# Altium schematic sheet [04] - RAM INTERFACE.SchDoc
size A2; DocumentNumber: 2; SheetNumber: 4; SheetTotal: 10
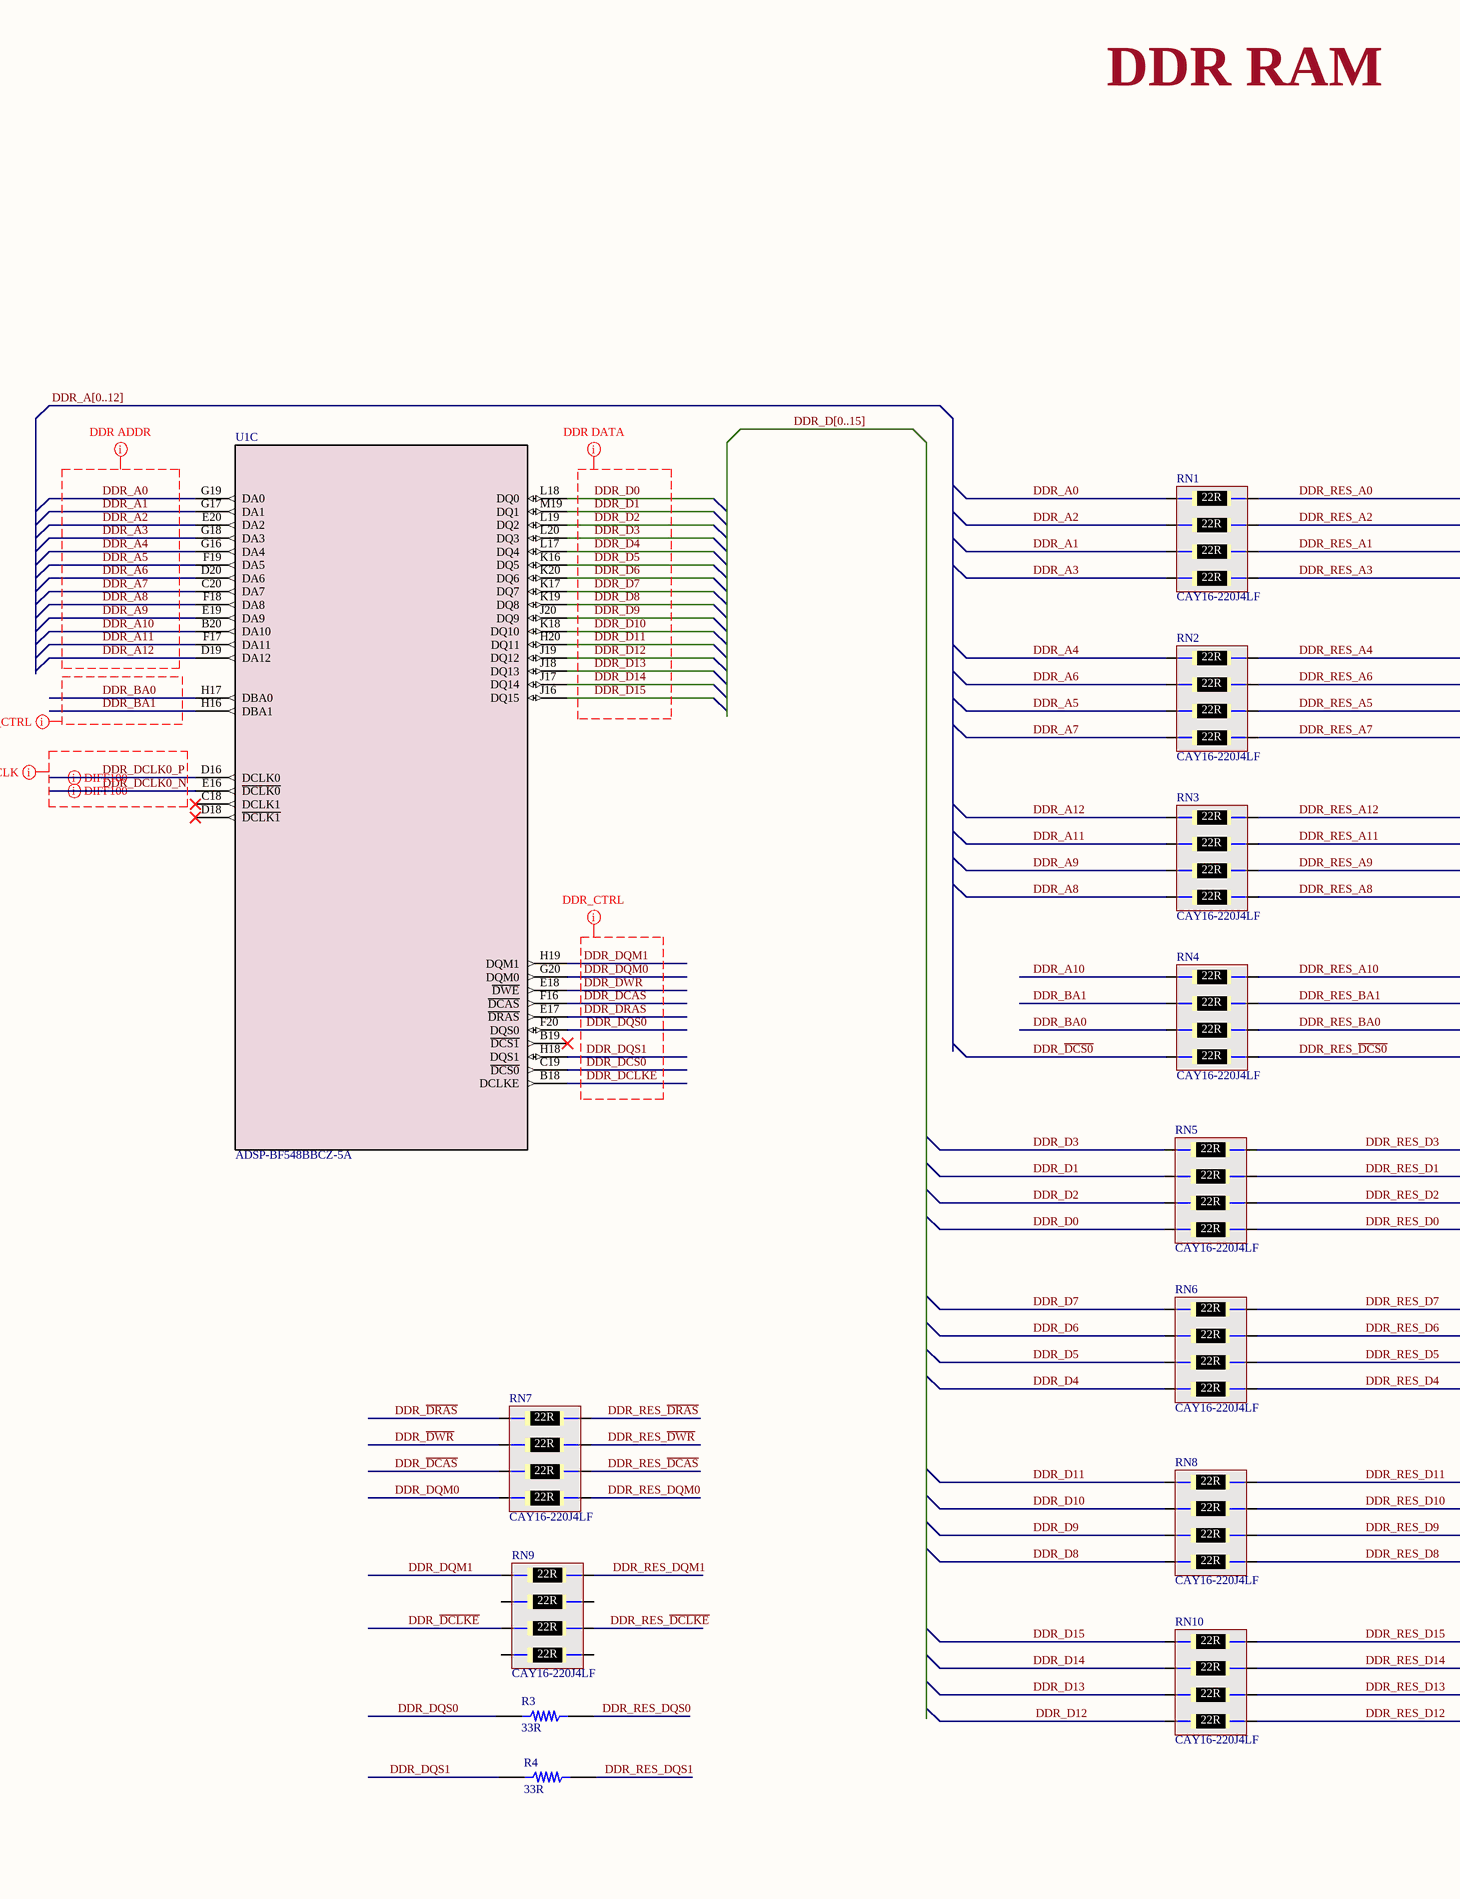
[diagram p0: [04] - RAM INTERFACE.SchDoc, left]
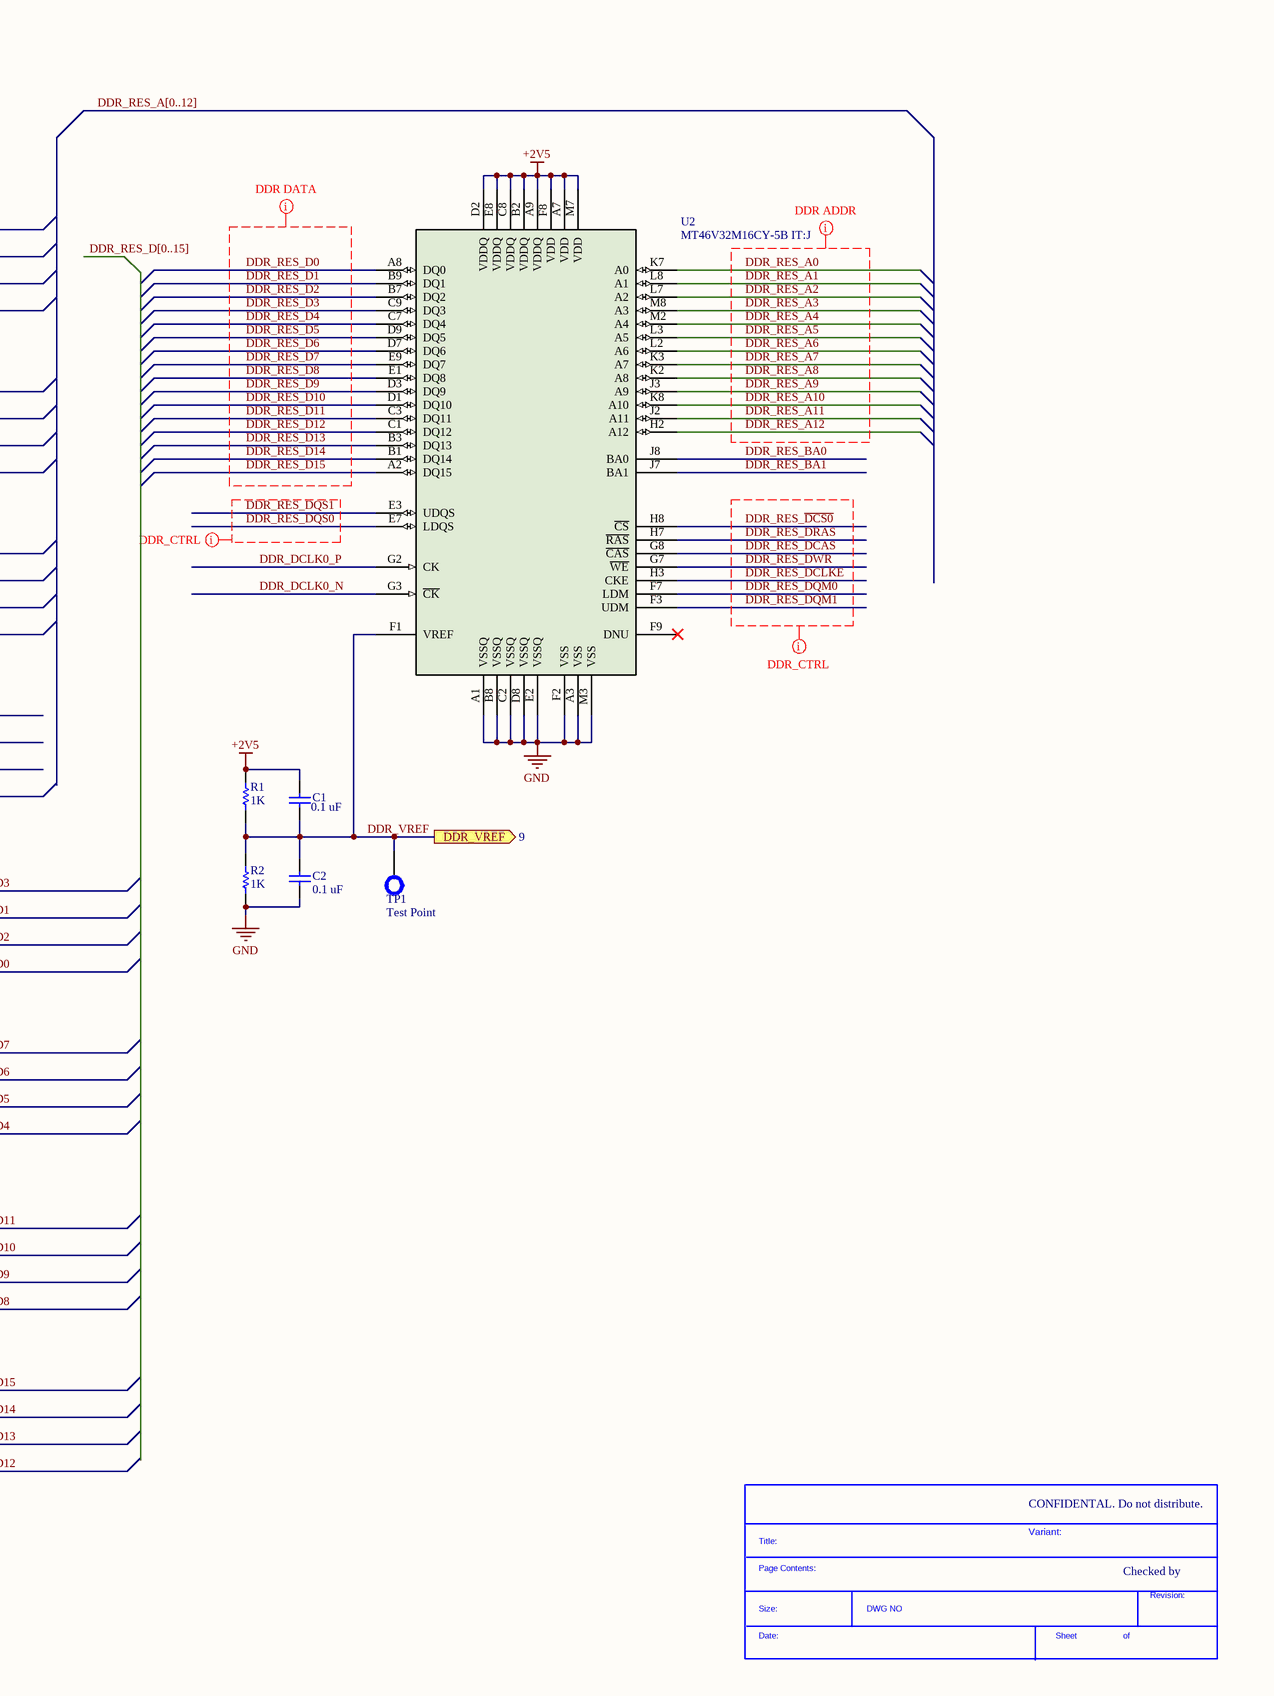
[diagram p1: [04] - RAM INTERFACE.SchDoc, right]

## Parts
*  SDTitleBlock  (value not drawn)  (graphical)
C1  0.1 uF  [CAP0402]
C2  0.1 uF  [CAP0402]
R1  1K  [RES0402]
R2  1K  [RES0402]
R3  33R  [RES0402]
R4  33R  [RES0402]
RN1  CAY16-220J4LF  [BO_CAY16]
RN2  CAY16-220J4LF  [BO_CAY16]
RN3  CAY16-220J4LF  [BO_CAY16]
RN4  CAY16-220J4LF  [BO_CAY16]
RN5  CAY16-220J4LF  [BO_CAY16]
RN6  CAY16-220J4LF  [BO_CAY16]
RN7  CAY16-220J4LF  [BO_CAY16]
RN8  CAY16-220J4LF  [BO_CAY16]
RN9  CAY16-220J4LF  [BO_CAY16]
RN10  CAY16-220J4LF  [BO_CAY16]
TP1  Test Point  [TP_70MIL]
U1  ADSP-BF548BBCZ-5A  [BC_400_1_ADI]  (part C of 7)
U2  MT46V32M16CY-5B IT:J  [FBGA60_10X12P5_MRN]

## Ports
DDR_VREF (out, see 9)

## Nets
+2V5: C1.2 R1.2 U2.A7(VDD) U2.A9(VDDQ) U2.B2(VDDQ) U2.C8(VDDQ) U2.D2(VDDQ) U2.E8(VDDQ) U2.F8(VDD) U2.M7(VDD)
GND: C2.1 R2.1 U2.A1(VSSQ) U2.A3(VSS) U2.B8(VSSQ) U2.C2(VSSQ) U2.D8(VSSQ) U2.E2(VSSQ) U2.F2(VSS) U2.M3(VSS)
DDR_A0: RN1.1 U1.G19(DA0)
DDR_A1: RN1.3 U1.G17(DA1)
DDR_A2: RN1.2 U1.E20(DA2)
DDR_A3: RN1.4 U1.G18(DA3)
DDR_A4: RN2.1 U1.G16(DA4)
DDR_A5: RN2.3 U1.F19(DA5)
DDR_A6: RN2.2 U1.D20(DA6)
DDR_A7: RN2.4 U1.C20(DA7)
DDR_A8: RN3.4 U1.F18(DA8)
DDR_A9: RN3.3 U1.E19(DA9)
DDR_A10: RN4.1 U1.B20(DA10)
DDR_A11: RN3.2 U1.F17(DA11)
DDR_A12: RN3.1 U1.D19(DA12)
DDR_BA0: RN4.3 U1.H17(DBA0)
DDR_BA1: RN4.2 U1.H16(DBA1)
DDR_D0: RN5.4 U1.L18(DQ0)
DDR_D1: RN5.2 U1.M19(DQ1)
DDR_D2: RN5.3 U1.L19(DQ2)
DDR_D3: RN5.1 U1.L20(DQ3)
DDR_D4: RN6.4 U1.L17(DQ4)
DDR_D5: RN6.3 U1.K16(DQ5)
DDR_D6: RN6.2 U1.K20(DQ6)
DDR_D7: RN6.1 U1.K17(DQ7)
DDR_D8: RN8.4 U1.K19(DQ8)
DDR_D9: RN8.3 U1.J20(DQ9)
DDR_D10: RN8.2 U1.K18(DQ10)
DDR_D11: RN8.1 U1.H20(DQ11)
DDR_D12: RN10.4 U1.J19(DQ12)
DDR_D13: RN10.3 U1.J18(DQ13)
DDR_D14: RN10.2 U1.J17(DQ14)
DDR_D15: RN10.1 U1.J16(DQ15)
DDR_~{DCAS}: RN7.3 U1.F16(~{DCAS})
DDR_~{DCLKE}: RN9.3 U1.B18(DCLKE)
DDR_~{DCS0}: RN4.4 U1.C19(~{DCS0})
DDR_~{DRAS}: RN7.1 U1.E17(~{DRAS})
DDR_~{DWR}: RN7.2 U1.E18(~{DWE})
DDR_DCLK0_N: U1.E16(~{DCLK0}) U2.G3(~{CK})
DDR_DCLK0_P: U1.D16(DCLK0) U2.G2(CK)
DDR_DQM0: RN7.4 U1.G20(DQM0)
DDR_DQM1: RN9.1 U1.H19(DQM1)
DDR_DQS0: R3.1 U1.F20(DQS0)
DDR_DQS1: R4.1 U1.H18(DQS1)
DDR_RES_A0: RN1.8 U2.K7(A0)
DDR_RES_A1: RN1.6 U2.L8(A1)
DDR_RES_A2: RN1.7 U2.L7(A2)
DDR_RES_A3: RN1.5 U2.M8(A3)
DDR_RES_A4: RN2.8 U2.M2(A4)
DDR_RES_A5: RN2.6 U2.L3(A5)
DDR_RES_A6: RN2.7 U2.L2(A6)
DDR_RES_A7: RN2.5 U2.K3(A7)
DDR_RES_A8: RN3.5 U2.K2(A8)
DDR_RES_A9: RN3.6 U2.J3(A9)
DDR_RES_A10: RN4.8 U2.K8(A10)
DDR_RES_A11: RN3.7 U2.J2(A11)
DDR_RES_A12: RN3.8 U2.H2(A12)
DDR_RES_BA0: RN4.6 U2.J8(BA0)
DDR_RES_BA1: RN4.7 U2.J7(BA1)
DDR_RES_D0: RN5.5 U2.A8(DQ0)
DDR_RES_D1: RN5.7 U2.B9(DQ1)
DDR_RES_D2: RN5.6 U2.B7(DQ2)
DDR_RES_D3: RN5.8 U2.C9(DQ3)
DDR_RES_D4: RN6.5 U2.C7(DQ4)
DDR_RES_D5: RN6.6 U2.D9(DQ5)
DDR_RES_D6: RN6.7 U2.D7(DQ6)
DDR_RES_D7: RN6.8 U2.E9(DQ7)
DDR_RES_D8: RN8.5 U2.E1(DQ8)
DDR_RES_D9: RN8.6 U2.D3(DQ9)
DDR_RES_D10: RN8.7 U2.D1(DQ10)
DDR_RES_D11: RN8.8 U2.C3(DQ11)
DDR_RES_D12: RN10.5 U2.C1(DQ12)
DDR_RES_D13: RN10.6 U2.B3(DQ13)
DDR_RES_D14: RN10.7 U2.B1(DQ14)
DDR_RES_D15: RN10.8 U2.A2(DQ15)
DDR_RES_~{DCAS}: RN7.6 U2.G8(~{CAS})
DDR_RES_~{DCLKE}: RN9.6 U2.H3(CKE)
DDR_RES_~{DCS0}: RN4.5 U2.H8(~{CS})
DDR_RES_~{DRAS}: RN7.8 U2.H7(~{RAS})
DDR_RES_~{DWR}: RN7.7 U2.G7(~{WE})
DDR_RES_DQM0: RN7.5 U2.F7(LDM)
DDR_RES_DQM1: RN9.8 U2.F3(UDM)
DDR_RES_DQS0: R3.2 U2.E7(LDQS)
DDR_RES_DQS1: R4.2 U2.E3(UDQS)
DDR_VREF: C1.1 C2.2 R1.1 R2.2 TP1.0 U2.F1(VREF) ; port DDR_VREF

Not connected (* = marked no-connect by the designer): RN9 2 4 5 7; U1 B19(~{DCS1})* C18(DCLK1)* D18(~{DCLK1})*; U2 F9(DNU)*

## Buses and harness runs
bus DDR_A[0..12]
bus DDR_D[0..15]
bus DDR_RES_A[0..12]
bus DDR_RES_D[0..15]

## Layout directives
net class DDR_ADDR: DDR_A0, DDR_A1, DDR_A2, DDR_A3, DDR_A4, DDR_A5, DDR_A6, DDR_A7, DDR_A8, DDR_A9, DDR_A10, DDR_A11, DDR_A12, DDR_RES_A0, DDR_RES_A1, DDR_RES_A2, DDR_RES_A3, DDR_RES_A4, DDR_RES_A5, DDR_RES_A6, DDR_RES_A7, DDR_RES_A8, DDR_RES_A9, DDR_RES_A10, DDR_RES_A11, DDR_RES_A12
net class DDR_DATA: DDR_D0, DDR_D1, DDR_D2, DDR_D3, DDR_D4, DDR_D5, DDR_D6, DDR_D7, DDR_D8, DDR_D9, DDR_D10, DDR_D11, DDR_D12, DDR_D13, DDR_D14, DDR_D15, DDR_RES_D0, DDR_RES_D1, DDR_RES_D2, DDR_RES_D3, DDR_RES_D4, DDR_RES_D5, DDR_RES_D6, DDR_RES_D7, DDR_RES_D8, DDR_RES_D9, DDR_RES_D10, DDR_RES_D11, DDR_RES_D12, DDR_RES_D13, DDR_RES_D14, DDR_RES_D15
differential pair; net class DIFF100: DDR_DCLK0_N, DDR_DCLK0_P
mark named DDR_CTRL: DDR_BA0, DDR_BA1, DDR_DQM0, DDR_DQM1, DDR_DQS0, DDR_DQS1, DDR_RES_DQM0, DDR_RES_DQM1, DDR_RES_DQS0, DDR_RES_DQS1, DDR_RES_~{DCAS}, DDR_RES_~{DCLKE}, DDR_RES_~{DCS0}, DDR_RES_~{DRAS}, DDR_RES_~{DWR}, DDR_~{DCAS}, DDR_~{DCLKE}, DDR_~{DCS0}, DDR_~{DRAS}, DDR_~{DWR}
mark named DDR_CLK: DDR_DCLK0_N, DDR_DCLK0_P

## Notes on the sheet
- DDR RAM
- CONFIDENTAL. Do not distribute.
- Variant:
- Checked by
- (in symbol CAY16-220J4LF) 22R
- (in symbol SDTitleBlock) Title:; Page Contents:; Revision:; Size:; DWG NO; Date:; Sheet; of

## Library data of the parts
C1 C2 = 0402ZD104KAT2A: Chip Capacitor, 0.1 uF, +/- 10%, 10 V, -55 to 85 degC, 0402 (1005 Metric), RoHS, Tape and Reel; Voltage Rating: 10 V; Capacitance: 100 nF; Case\Package: 0402; Type (Capacitors): X5R; Min Operating Temperature: -55 degC; Max Operating Temperature: 85 degC; ComponentLink2URL: http://datasheets.avx.com/cx5r.pdf; Packaging: Cut Tape; Tolerance: 10%; Pins: 2; Case Code (Imperial): 0402; PackageDescription: 2-Pin Surface Mount Device, Body 1 x 0.5 mm; ComponentLink1Description: Manufacturer URL; DatasheetVersion: 05/2016; Width: 0.5 mm; ComponentLink1URL: http://www.avx.com/; Length: 1 mm; Package Quantity: 1; PackageReference: 0402; Mount: Surface Mount; Radiation Hardening: No; REACH SVHC: No SVHC; Mounting Technology: Surface Mount; ComponentLink2Description: Datasheet; RoHSCompliant: true; Case Code (Metric): 1005; Height: 0.56 mm; Voltage Rating (DC): 10 V
R1 R2 = RT0402FRE071KL: 1 kOhms ±1% 0.063W, 1/16W Chip Resistor 0402 (1005 Metric)  Thin Film; Manufacturer: Yageo; Resistance: 1kR; Temperature Coefficient: 50ppm/°C; Power Rating: 62.5mW; Voltage Rating: 50V; Max Power Dissipation: 63mW; Part Number: RT0402FRE071KL; Supplier 1: Digi-Key; Manufacturer Part Number: RT0402FRE071KL; RoHS: Yes; Category: Chip SMD Resistors; Stock 1: 115371; Pricing 1: 1=0.10000, 10=0.07000, 100=0.02830, 1000=0.01272, 2500=0.01104, 5000=0.00912 (USD); Case/Package: 0402; Contact Plating: Tin,Matte,Lead; Case Code (Metric): 1005; Case Code (Imperial): 0402; Min Operating Temperature: -55°C; Max Operating Temperature: 125°C; Tolerance: 1%; Resistor Type: Thin Film; Package Quantity: 10000; Packaging: Tape and Reel; Number of Terminations: 2; Termination: SMD/SMT; Voltage Rating (DC): 50V; Features: Moisture Resistant; Length: 1mm; Width: 0.02inch; Height: 0.014inch; Depth: 0.5mm; Radiation Hardening: No; Military Standard: Not; Lead Free: Lead Free; ComponentLink1URL: https://datasheet.ciiva.com/12834/pyu-rt-1-to-0-05-rohs-l-4-12834181.pdf?src-supplier=Mouser; ComponentLink1Description: https://datasheet.ciiva.com/12834/pyu-rt-1-to-0-05-rohs-l-4-12834181.pdf?src-supplier=Mouser; ComponentLink2URL: https://datasheet.ciiva.com/25647/pyu-rt-1-to-0-05-rohs-l-4-25647306.pdf?src-supplier=Digi-Key; ComponentLink2Description: https://datasheet.ciiva.com/25647/pyu-rt-1-to-0-05-rohs-l-4-25647306.pdf?src-supplier=Digi-Key; ComponentLink3URL: https://datasheet.ciiva.com/8896/pyu-rt-1-to-0-05-rohs-l-4-8896188.pdf?src-supplier=Avnet; ComponentLink3Description: https://datasheet.ciiva.com/8896/pyu-rt-1-to-0-05-rohs-l-4-8896188.pdf?src-supplier=Avnet
R3 R4 = CRCW040233R0JNEE: 33 Ohms ±5% 0.063W, 1/16W Chip Resistor 0402 (1005 Metric) Automotive AEC-Q200 Thick Film; Manufacturer: Vishay Dale; Digi-Key Part Number: CRCW040233R0JNEE-ND; Manufacturer Product Number: CRCW040233R0JNEE; Supplier: Vishay Dale; Package / Case: 0402; Resistance: 33R
RN1-RN10 = CAY16-220J4LF: 22 Ohm ±5% 62.5mW Power Per Element Isolated Resistor Network/Array ±200ppm/°C 1206 (3216 Metric), Convex, Long Side Terminals; Manufacturer: Bourns Inc.; Manufacturer Product Number: CAY16-220J4LF; Power Per Element: 62.5mW; Tolerance: ±5%; Digi-Key Part Number: CAY16-220J4LFDKR-ND
TP1 = TP
U1 = ADSP-BF548BBCZ-5A: IC DSP 16BIT 533MHZ 400CSBGA; Manufacturer: Analog Devices Inc.; Manufacturer_Part_Number: ADSP-BF548BBCZ-5A; Supplier: Analog Devices Inc.; Manufacturer Product Number: ADSP-BF548BBCZ-5A; TypeDigi-Key Part Number: ADSP-BF548BBCZ-5A-ND
U2 = MT46V32M16CY-5B IT:J TR: SDRAM - DDR Memory IC 512Mb (32M x 16) Parallel 200MHz 700ps 60-FBGA (8x12.5); Manufacturer: Micron Technology Inc.; Manufacturer Product Number: MT46V32M16CY-5B IT:J; Digi-Key Part Number: MT46V32M16CY-5BIT:J-ND; Package / Case: 60-TFBGA; Supplier: Micron Technology Inc.; Series: -